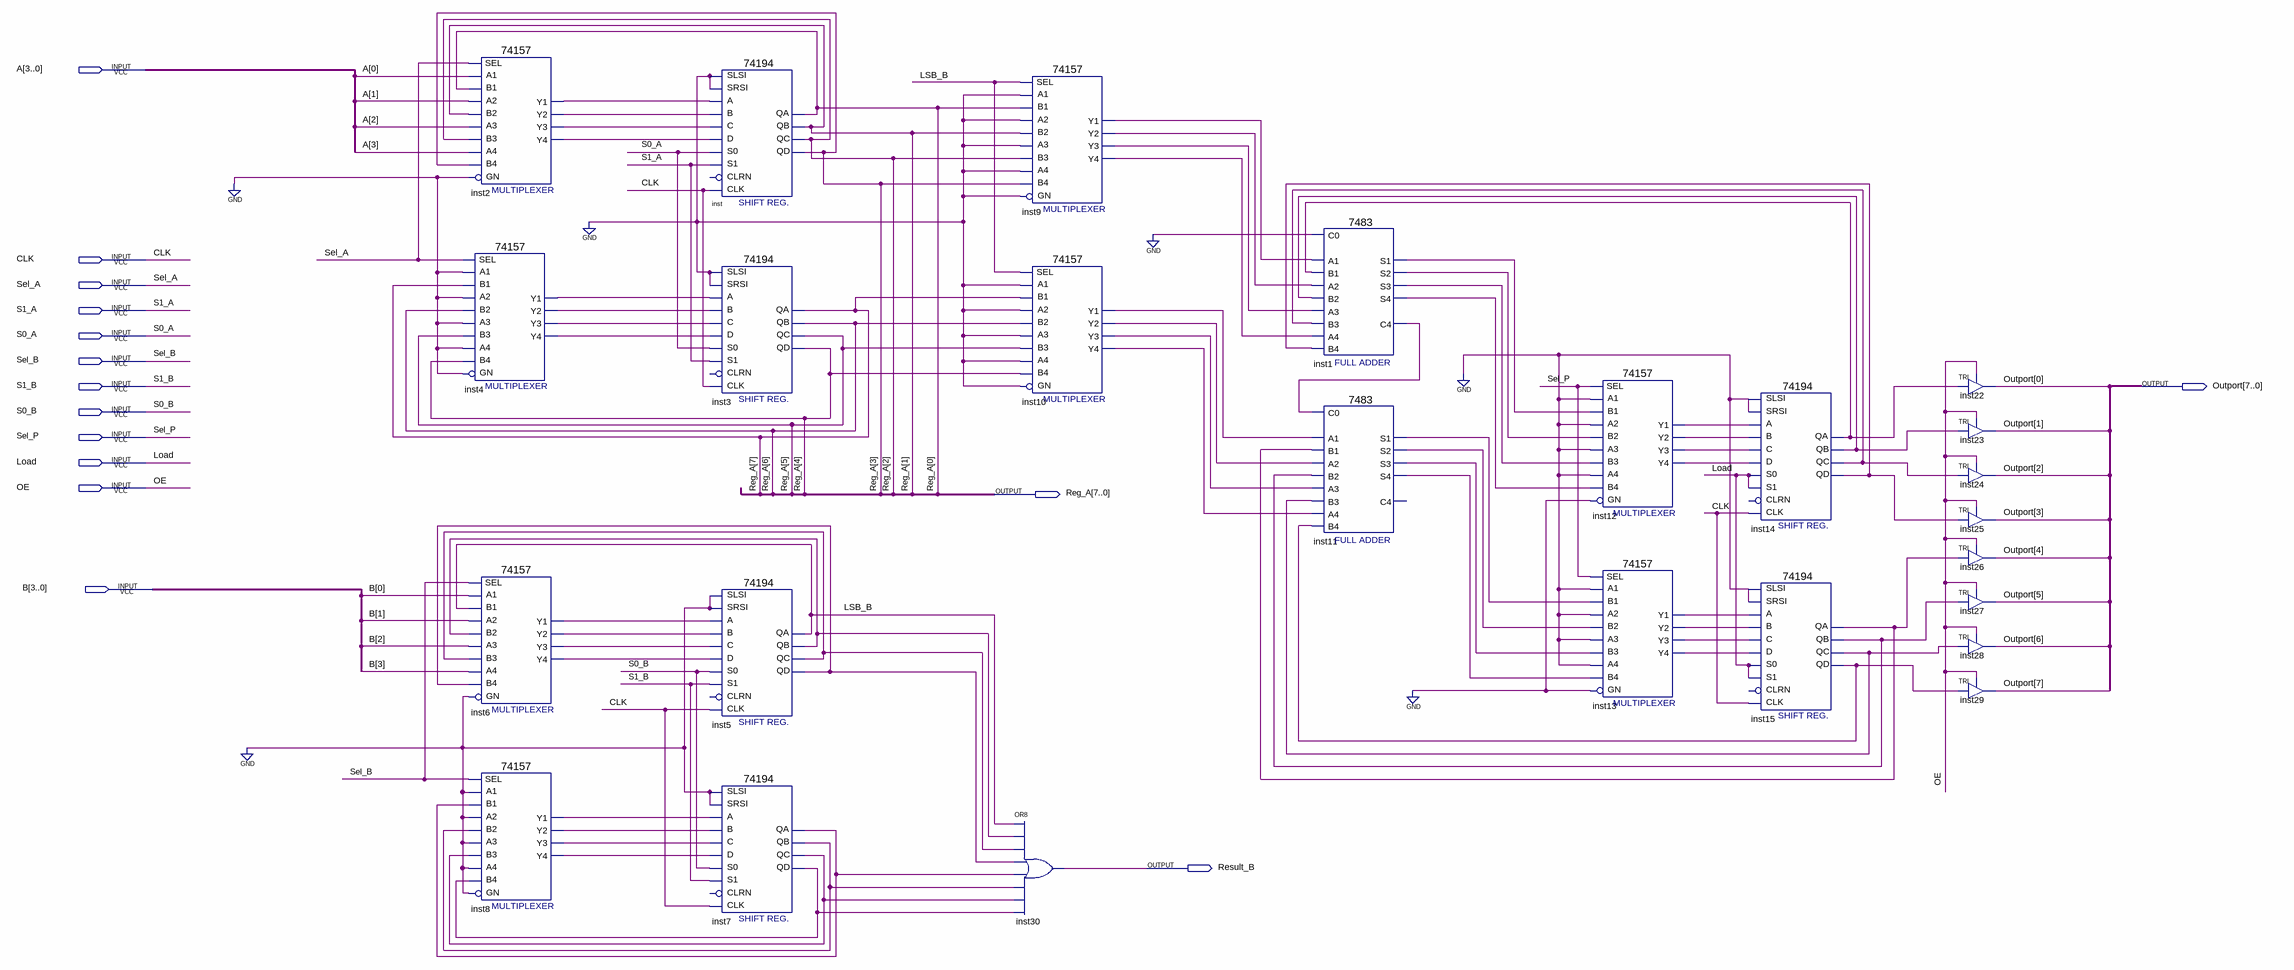
[diagram p0: schematic sheet]
// Quartus schematic Datapath_Multify_4bit.bdf as structural Verilog: 25 symbols, 15 pins
module Datapath_Multify_4bit (
  input  [3:0] A,
  input  CLK,
  input  Sel_A,
  input  S1_A,
  input  S0_A,
  input  Sel_B,
  input  S1_B,
  input  S0_B,
  input  Sel_P,
  input  Load,
  input  OE,
  input  [3:0] B,
  output [7:0] Outport,
  output [7:0] Reg_A,
  output Result_B
);

  wire inst1_c4, inst1_s1, inst1_s2, inst1_s3, inst1_s4, inst2_y1, inst2_y2, inst2_y3, inst2_y4, inst4_y1,
       inst4_y2, inst4_y3, inst4_y4, inst5_qb, inst5_qc, inst5_qd, inst6_y1, inst6_y2, inst6_y3, inst6_y4,
       inst7_qa, inst7_qb, inst7_qc, inst7_qd, inst8_y1, inst8_y2, inst8_y3, inst8_y4, inst9_y1, inst9_y2,
       inst9_y3, inst9_y4, inst10_y1, inst10_y2, inst10_y3, inst10_y4, inst11_s1, inst11_s2, inst11_s3,
       inst11_s4, inst12_y1, inst12_y2, inst12_y3, inst12_y4, inst13_y1, inst13_y2, inst13_y3, inst13_y4,
       inst14_qa, inst14_qb, inst14_qc, inst14_qd, inst15_qa, inst15_qb, inst15_qc, inst15_qd, LSB_B;

  \74157  inst2 (
    .A1(A[0]), .B1(Reg_A[0]), .SEL(Sel_A), .B2(Reg_A[1]), .A3(A[2]), .B3(Reg_A[2]), .A2(A[1]), .B4(Reg_A[3]),
    .GN(1'b0), .A4(A[3]), .Y2(inst2_y2), .Y1(inst2_y1), .Y4(inst2_y4), .Y3(inst2_y3));
  \74157  inst4 (
    .A1(1'b0), .B1(Reg_A[7]), .SEL(Sel_A), .B2(Reg_A[6]), .A3(1'b0), .B3(Reg_A[5]), .A2(1'b0), .B4(Reg_A[4]),
    .GN(1'b0), .A4(1'b0), .Y2(inst4_y2), .Y1(inst4_y1), .Y4(inst4_y4), .Y3(inst4_y3));
  \74157  inst6 (
    .A1(B[0]), .B1(LSB_B), .SEL(Sel_B), .B2(inst5_qb), .A3(B[2]), .B3(inst5_qc), .A2(B[1]), .B4(inst5_qd),
    .GN(1'b0), .A4(B[3]), .Y2(inst6_y2), .Y1(inst6_y1), .Y4(inst6_y4), .Y3(inst6_y3));
  \74157  inst8 (
    .A1(1'b0), .B1(inst7_qa), .SEL(Sel_B), .B2(inst7_qb), .A3(1'b0), .B3(inst7_qc), .A2(1'b0), .B4(inst7_qd),
    .GN(1'b0), .A4(1'b0), .Y2(inst8_y2), .Y1(inst8_y1), .Y4(inst8_y4), .Y3(inst8_y3));
  \74194  inst (
    .SLSI(1'b0), .SRSI(1'b0), .B(inst2_y2), .C(inst2_y3), .CLK(CLK), .D(inst2_y4), .S1(S1_A), .S0(S0_A),
    .A(inst2_y1), .QA(Reg_A[0]), .QB(Reg_A[1]), .QC(Reg_A[2]), .QD(Reg_A[3]));  // open: CLRN
  \74194  inst3 (
    .SLSI(1'b0), .SRSI(1'b0), .B(inst4_y2), .C(inst4_y3), .CLK(CLK), .D(inst4_y4), .S1(S1_A), .S0(S0_A),
    .A(inst4_y1), .QA(Reg_A[7]), .QB(Reg_A[6]), .QC(Reg_A[5]), .QD(Reg_A[4]));  // open: CLRN
  \74194  inst5 (
    .SLSI(1'b0), .SRSI(1'b0), .B(inst6_y2), .C(inst6_y3), .CLK(CLK), .D(inst6_y4), .S1(S1_B), .S0(S0_B),
    .A(inst6_y1), .QA(LSB_B), .QB(inst5_qb), .QC(inst5_qc), .QD(inst5_qd));  // open: CLRN
  \74194  inst7 (
    .SLSI(1'b0), .SRSI(1'b0), .B(inst8_y2), .C(inst8_y3), .CLK(CLK), .D(inst8_y4), .S1(S1_B), .S0(S0_B),
    .A(inst8_y1), .QA(inst7_qa), .QB(inst7_qb), .QC(inst7_qc), .QD(inst7_qd));  // open: CLRN
  \74157  inst9 (
    .A1(1'b0), .B1(Reg_A[0]), .SEL(LSB_B), .B2(Reg_A[1]), .A3(1'b0), .B3(Reg_A[2]), .A2(1'b0), .B4(Reg_A[3]),
    .GN(1'b0), .A4(1'b0), .Y2(inst9_y2), .Y1(inst9_y1), .Y4(inst9_y4), .Y3(inst9_y3));
  \74157  inst10 (
    .A1(1'b0), .B1(Reg_A[7]), .SEL(LSB_B), .B2(Reg_A[6]), .A3(1'b0), .B3(Reg_A[5]), .A2(1'b0), .B4(Reg_A[4]),
    .GN(1'b0), .A4(1'b0), .Y2(inst10_y2), .Y1(inst10_y1), .Y4(inst10_y4), .Y3(inst10_y3));
  or inst30 (Result_B, LSB_B, inst5_qb, inst5_qc, inst5_qd, inst7_qa, inst7_qb, inst7_qc, inst7_qd);
  \7483  inst1 (
    .B4(inst14_qd), .C0(1'b0), .A1(inst9_y1), .A2(inst9_y2), .B1(inst14_qa), .B2(inst14_qb), .A3(inst9_y3),
    .B3(inst14_qc), .A4(inst9_y4), .S3(inst1_s3), .S4(inst1_s4), .S2(inst1_s2), .C4(inst1_c4), .S1(inst1_s1));
  \7483  inst11 (
    .B4(inst15_qd), .C0(inst1_c4), .A1(inst10_y1), .A2(inst10_y2), .B1(inst15_qa), .B2(inst15_qb),
    .A3(inst10_y3), .B3(inst15_qc), .A4(inst10_y4), .S3(inst11_s3), .S4(inst11_s4), .S2(inst11_s2),
    .S1(inst11_s1));  // open: C4
  \74157  inst12 (
    .A1(1'b0), .B1(inst1_s1), .SEL(Sel_P), .B2(inst1_s2), .A3(1'b0), .B3(inst1_s3), .A2(1'b0), .B4(inst1_s4),
    .GN(1'b0), .A4(1'b0), .Y2(inst12_y2), .Y1(inst12_y1), .Y4(inst12_y4), .Y3(inst12_y3));
  \74157  inst13 (
    .A1(1'b0), .B1(inst11_s1), .SEL(Sel_P), .B2(inst11_s2), .A3(1'b0), .B3(inst11_s3), .A2(1'b0),
    .B4(inst11_s4), .GN(1'b0), .A4(1'b0), .Y2(inst13_y2), .Y1(inst13_y1), .Y4(inst13_y4), .Y3(inst13_y3));
  \74194  inst14 (
    .SLSI(1'b0), .SRSI(1'b0), .B(inst12_y2), .C(inst12_y3), .CLK(CLK), .D(inst12_y4), .S1(Load), .S0(Load),
    .A(inst12_y1), .QA(inst14_qa), .QB(inst14_qb), .QC(inst14_qc), .QD(inst14_qd));  // open: CLRN
  \74194  inst15 (
    .SLSI(1'b0), .SRSI(1'b0), .B(inst13_y2), .C(inst13_y3), .CLK(CLK), .D(inst13_y4), .S1(Load), .S0(Load),
    .A(inst13_y1), .QA(inst15_qa), .QB(inst15_qb), .QC(inst15_qc), .QD(inst15_qd));  // open: CLRN
  TRI inst22 (.IN(inst14_qa), .OE(OE), .OUT(Outport[0]));
  TRI inst23 (.IN(inst14_qb), .OE(OE), .OUT(Outport[1]));
  TRI inst24 (.IN(inst14_qc), .OE(OE), .OUT(Outport[2]));
  TRI inst25 (.IN(inst14_qd), .OE(OE), .OUT(Outport[3]));
  TRI inst26 (.IN(inst15_qa), .OE(OE), .OUT(Outport[4]));
  TRI inst27 (.IN(inst15_qb), .OE(OE), .OUT(Outport[5]));
  TRI inst28 (.IN(inst15_qc), .OE(OE), .OUT(Outport[6]));
  TRI inst29 (.IN(inst15_qd), .OE(OE), .OUT(Outport[7]));
endmodule
